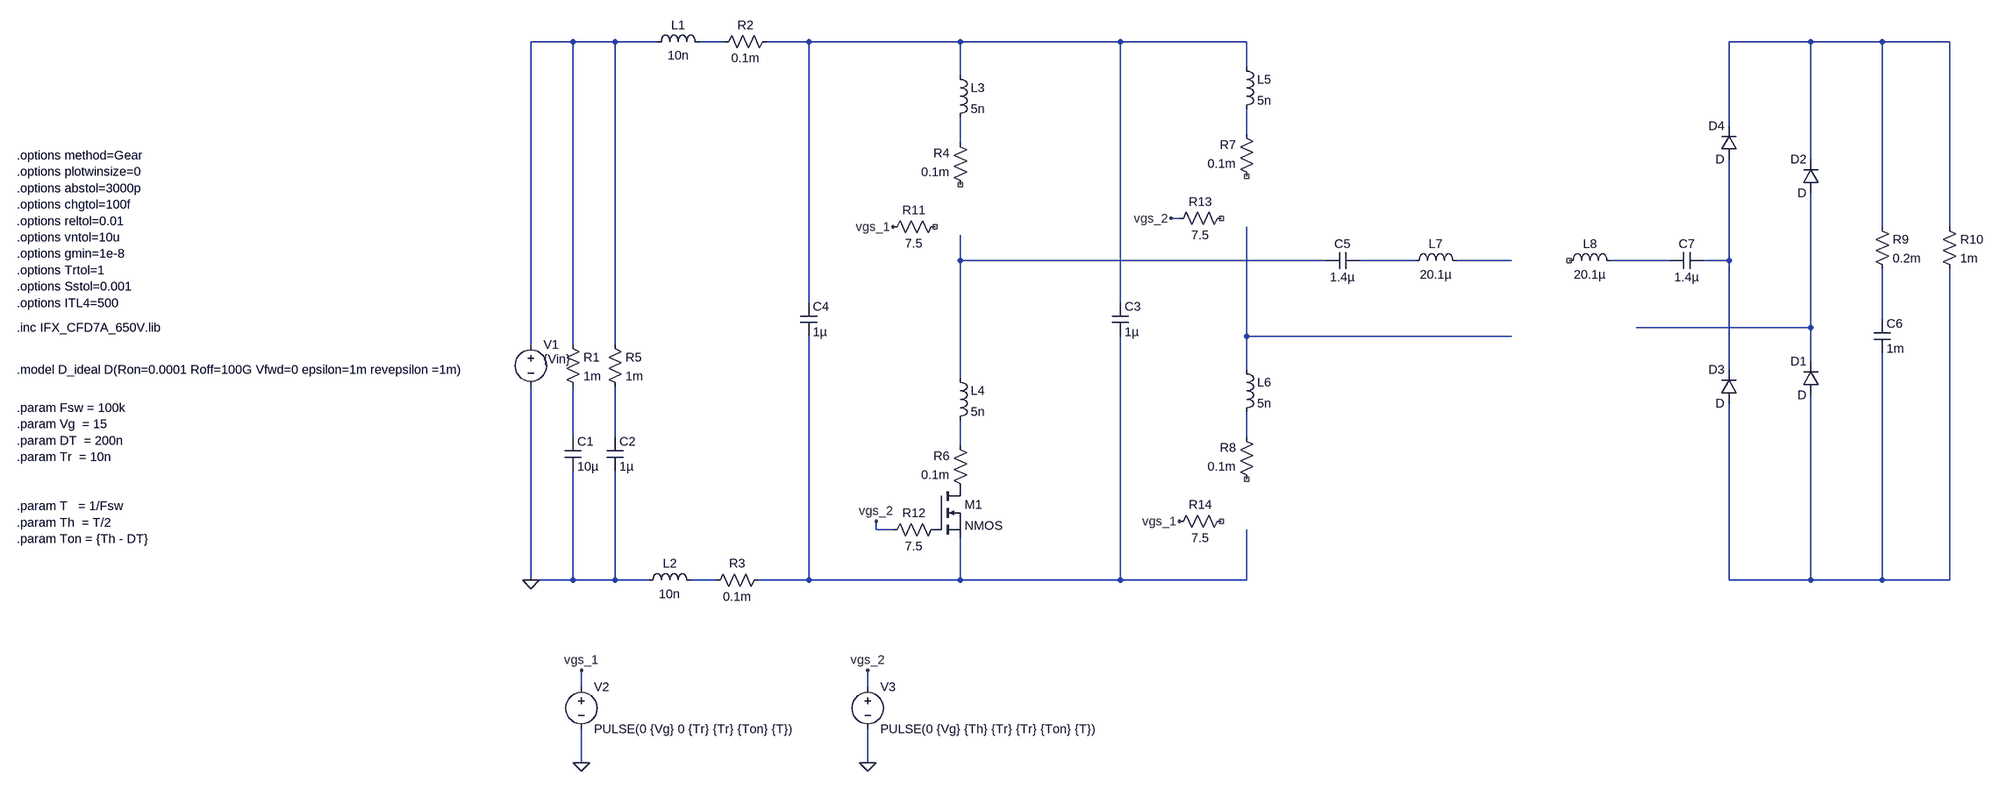
[diagram p0: schematic CLLC_v1.asc]
CLLC_v1.asc, the LTspice schematic file:
Version 4.1
SHEET 1 3956 1536
WIRE 464 -16 384 -16
WIRE 544 -16 464 -16
WIRE 624 -16 544 -16
WIRE 752 -16 704 -16
WIRE 912 -16 832 -16
WIRE 1200 -16 912 -16
WIRE 1504 -16 1200 -16
WIRE 1744 -16 1504 -16
WIRE 3456 -16 3152 -16
WIRE 3760 -16 3456 -16
WIRE 3888 -16 3760 -16
WIRE 1744 32 1744 -16
WIRE 1200 48 1200 -16
WIRE 3152 144 3152 -16
WIRE 1744 160 1744 112
WIRE 1200 176 1200 128
WIRE 3456 208 3456 -16
WIRE 1616 320 1600 320
WIRE 3760 336 3760 -16
WIRE 3888 336 3888 -16
WIRE 1200 400 1200 352
WIRE 2016 400 1200 400
WIRE 2192 400 2080 400
WIRE 2432 400 2272 400
WIRE 3040 400 2928 400
WIRE 3152 400 3152 208
WIRE 3152 400 3104 400
WIRE 912 480 912 -16
WIRE 1504 480 1504 -16
WIRE 3760 512 3760 416
WIRE 3456 528 3456 272
WIRE 3456 528 2976 528
WIRE 1744 544 1744 336
WIRE 2432 544 1744 544
WIRE 384 560 384 -16
WIRE 464 560 464 -16
WIRE 544 560 544 -16
WIRE 3456 592 3456 528
WIRE 1744 608 1744 544
WIRE 3152 608 3152 400
WIRE 1200 624 1200 400
WIRE 464 736 464 640
WIRE 544 736 544 640
WIRE 1744 736 1744 688
WIRE 1200 752 1200 704
WIRE 1040 912 1040 896
WIRE 1072 912 1040 912
WIRE 384 1008 384 640
WIRE 464 1008 464 800
WIRE 464 1008 384 1008
WIRE 544 1008 544 800
WIRE 544 1008 464 1008
WIRE 608 1008 544 1008
WIRE 736 1008 688 1008
WIRE 912 1008 912 544
WIRE 912 1008 816 1008
WIRE 1200 1008 1200 928
WIRE 1200 1008 912 1008
WIRE 1504 1008 1504 544
WIRE 1504 1008 1200 1008
WIRE 1744 1008 1744 912
WIRE 1744 1008 1504 1008
WIRE 3152 1008 3152 672
WIRE 3456 1008 3456 656
WIRE 3456 1008 3152 1008
WIRE 3760 1008 3760 576
WIRE 3760 1008 3456 1008
WIRE 3888 1008 3888 416
WIRE 3888 1008 3760 1008
WIRE 480 1248 480 1216
WIRE 1024 1248 1024 1216
WIRE 480 1392 480 1328
WIRE 1024 1392 1024 1328
FLAG 384 1008 0
FLAG 480 1216 vgs_1
FLAG 1072 336 vgs_1
FLAG 1616 896 vgs_1
FLAG 1024 1216 vgs_2
FLAG 1040 896 vgs_2
FLAG 1600 320 vgs_2
FLAG 480 1392 0
FLAG 1024 1392 0
SYMBOL voltage 384 544 R0
WINDOW 3 24 44 Left 2
WINDOW 123 0 0 Left 0
WINDOW 39 0 0 Left 0
SYMATTR InstName V1
SYMATTR Value {Vin}
SYMBOL res 448 544 R0
SYMATTR InstName R1
SYMATTR Value 1m
SYMBOL cap 448 736 R0
SYMATTR InstName C1
SYMATTR Value 10µ
SYMBOL ind 608 0 R270
WINDOW 0 32 56 VTop 2
WINDOW 3 5 56 VBottom 2
SYMATTR InstName L1
SYMATTR Value 10n
SYMBOL res 848 -32 R90
WINDOW 0 0 56 VBottom 2
WINDOW 3 32 56 VTop 2
SYMATTR InstName R2
SYMATTR Value 0.1m
SYMBOL ind 592 1024 R270
WINDOW 0 32 56 VTop 2
WINDOW 3 5 56 VBottom 2
SYMATTR InstName L2
SYMATTR Value 10n
SYMBOL res 832 992 R90
WINDOW 0 0 56 VBottom 2
WINDOW 3 32 56 VTop 2
SYMATTR InstName R3
SYMATTR Value 0.1m
SYMBOL ind 1184 32 R0
SYMATTR InstName L3
SYMATTR Value 5n
SYMBOL res 1216 272 R180
WINDOW 0 36 76 Left 2
WINDOW 3 36 40 Left 2
SYMATTR InstName R4
SYMATTR Value 0.1m
SYMBOL res 528 544 R0
SYMATTR InstName R5
SYMATTR Value 1m
SYMBOL cap 528 736 R0
SYMATTR InstName C2
SYMATTR Value 1µ
SYMBOL ind 1184 608 R0
SYMATTR InstName L4
SYMATTR Value 5n
SYMBOL res 1216 848 R180
WINDOW 0 36 76 Left 2
WINDOW 3 36 40 Left 2
SYMATTR InstName R6
SYMATTR Value 0.1m
SYMBOL ind 1728 16 R0
SYMATTR InstName L5
SYMATTR Value 5n
SYMBOL res 1760 256 R180
WINDOW 0 36 76 Left 2
WINDOW 3 36 40 Left 2
SYMATTR InstName R7
SYMATTR Value 0.1m
SYMBOL ind 1728 592 R0
SYMATTR InstName L6
SYMATTR Value 5n
SYMBOL res 1760 832 R180
WINDOW 0 36 76 Left 2
WINDOW 3 36 40 Left 2
SYMATTR InstName R8
SYMATTR Value 0.1m
SYMBOL cap 1488 480 R0
SYMATTR InstName C3
SYMATTR Value 1µ
SYMBOL cap 896 480 R0
SYMATTR InstName C4
SYMATTR Value 1µ
SYMBOL cap 2080 384 R90
WINDOW 0 0 32 VBottom 2
WINDOW 3 32 32 VTop 2
SYMATTR InstName C5
SYMATTR Value 1.4µ
SYMBOL ind 2176 416 R270
WINDOW 0 32 56 VTop 2
WINDOW 3 5 56 VBottom 2
SYMATTR InstName L7
SYMATTR Value 20.1µ
SYMBOL diode 3472 656 R180
WINDOW 0 24 64 Left 2
WINDOW 3 24 0 Left 2
SYMATTR InstName D1
SYMBOL diode 3472 272 R180
WINDOW 0 24 64 Left 2
WINDOW 3 24 0 Left 2
SYMATTR InstName D2
SYMBOL diode 3168 672 R180
WINDOW 0 24 64 Left 2
WINDOW 3 24 0 Left 2
SYMATTR InstName D3
SYMBOL diode 3168 208 R180
WINDOW 0 24 64 Left 2
WINDOW 3 24 0 Left 2
SYMATTR InstName D4
SYMBOL res 3744 320 R0
SYMATTR InstName R9
SYMATTR Value 0.2m
SYMBOL cap 3744 512 R0
SYMATTR InstName C6
SYMATTR Value 1m
SYMBOL res 3872 320 R0
SYMATTR InstName R10
SYMATTR Value 1m
SYMBOL cap 3040 416 R270
WINDOW 0 32 32 VTop 2
WINDOW 3 0 32 VBottom 2
SYMATTR InstName C7
SYMATTR Value 1.4µ
SYMBOL ind 2832 416 R270
WINDOW 0 32 56 VTop 2
WINDOW 3 5 56 VBottom 2
SYMATTR InstName L8
SYMATTR Value 20.1µ
SYMBOL voltage 480 1232 R0
WINDOW 123 0 0 Left 0
WINDOW 39 0 0 Left 0
SYMATTR InstName V2
SYMATTR Value PULSE(0 {Vg} 0 {Tr} {Tr} {Ton} {T})
SYMBOL voltage 1024 1232 R0
WINDOW 123 0 0 Left 0
WINDOW 39 0 0 Left 0
SYMATTR InstName V3
SYMATTR Value PULSE(0 {Vg} {Th} {Tr} {Tr} {Ton} {T})
SYMBOL res 1168 320 R90
WINDOW 0 0 56 VBottom 2
WINDOW 3 32 56 VTop 2
SYMATTR InstName R11
SYMATTR Value 7.5
SYMBOL res 1168 896 R90
WINDOW 0 0 56 VBottom 2
WINDOW 3 32 56 VTop 2
SYMATTR InstName R12
SYMATTR Value 7.5
SYMBOL res 1712 304 R90
WINDOW 0 0 56 VBottom 2
WINDOW 3 32 56 VTop 2
SYMATTR InstName R13
SYMATTR Value 7.5
SYMBOL res 1712 880 R90
WINDOW 0 0 56 VBottom 2
WINDOW 3 32 56 VTop 2
SYMATTR InstName R14
SYMATTR Value 7.5
SYMBOL nmos 1152 832 R0
SYMATTR InstName M1
TEXT -856 200 Left 2 !.options method=Gear\n.options plotwinsize=0\n.options abstol=3000p\n.options chgtol=100f\n.options reltol=0.01\n.options vntol=10u\n.options gmin=1e-8\n.options Trtol=1\n.options Sstol=0.001\n.options ITL4=500
TEXT -856 528 Left 2 !.inc IFX_CFD7A_650V.lib
TEXT -856 608 Left 2 !.model D_ideal D(Ron=0.0001 Roff=100G Vfwd=0 epsilon=1m revepsilon =1m)
TEXT -856 680 Left 2 !.param Fsw = 100k\n.param Vg  = 15\n.param DT  = 200n        \n.param Tr  = 10n         \n \n \n.param T   = 1/Fsw         \n.param Th  = T/2           \n.param Ton = {Th - DT}

The netlist it stands for:
* CLLC_v1.asc
V1 N001 0 {Vin}
R1 N001 N015 1m
C1 N015 0 10µ
L1 N001 N002 10n
R2 N003 N002 0.1m
L2 0 N019 10n
R3 N020 N019 0.1m
L3 N003 N006 5n
R4 NC_01 N006 0.1m
R5 N001 N016 1m
C2 N016 0 1µ
L4 N007 N018 5n
R6 P001 N018 0.1m
L5 N003 N005 5n
R7 NC_02 N005 0.1m
L6 N014 N017 5n
R8 NC_03 N017 0.1m
C3 N003 N020 1µ
C4 N003 N020 1µ
C5 N008 N007 1.4µ
L7 N008 N009 20.1µ
D1 N021 N013 D
D2 N013 N004 D
D3 N021 N011 D
D4 N011 N004 D
R9 N004 N012 0.2m
C6 N012 N021 1m
R10 N004 N021 1m
C7 N010 N011 1.4µ
L8 NC_04 N010 20.1µ
V2 vgs_1 0 PULSE(0 {Vg} 0 {Tr} {Tr} {Ton} {T})
V3 vgs_2 0 PULSE(0 {Vg} {Th} {Tr} {Tr} {Ton} {T})
R11 NC_05 vgs_1 7.5
R12 P002 vgs_2 7.5
R13 NC_06 vgs_2 7.5
R14 NC_07 vgs_1 7.5
M1 P001 P002 N020 N020 NMOS
.model D D
.lib standard.dio
.model NMOS NMOS
.model PMOS PMOS
.lib standard.mos
.options method=Gear
.options plotwinsize=0
.options abstol=3000p
.options chgtol=100f
.options reltol=0.01
.options vntol=10u
.options gmin=1e-8
.options Trtol=1
.options Sstol=0.001
.options ITL4=500
.inc IFX_CFD7A_650V.lib
.model D_ideal D(Ron=0.0001 Roff=100G Vfwd=0 epsilon=1m revepsilon =1m)
.param Fsw = 100k
.param Vg  = 15
.param DT  = 200n
.param Tr  = 10n
.param T   = 1/Fsw
.param Th  = T/2
.param Ton = {Th - DT}
.backanno
.end